# Altium schematic sheet Controller_Sheet.SchDoc
size 420 x 297 mm; SheetNumber: 4; SheetTotal: 4
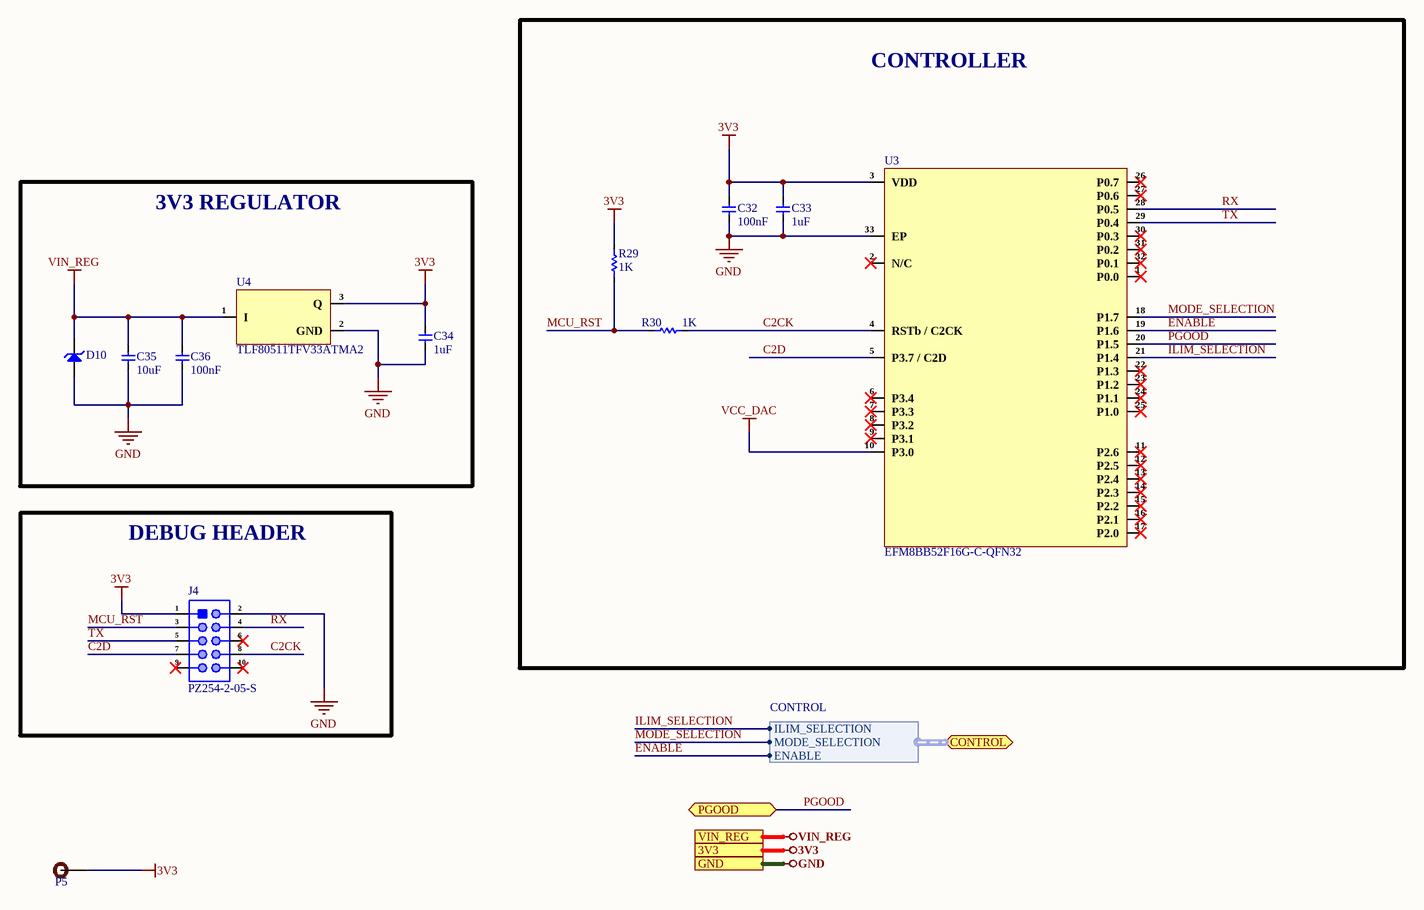
[diagram p0: Controller_Sheet.SchDoc]

## Parts
C32  100nF  [Cap-0603]
C33  1uF  [Cap-0603]
C34  1uF  [Cap-0603]
C35  10uF  [Cap-1206]
C36  100nF  [Cap-0603]
D10  1SMA5937BT3G  [SMA]  (value not drawn)
J4  PZ254-2-05-S  [PZ254-2-05-S]
P5  TEST POINT  [Test-point]  (value not drawn)  (no BOM)
R29  1K  [Res-0603]
R30  1K  [Res-0603]
U3  EFM8BB52F16G-C-QFN32  [32-QFN (5x5)]
U4  TLF80511TFV33ATMA2  [TO-252-2L]

## Blocks framed on the sheet
CONTROLLER: C32 C33 R29 R30 U3
3V3 REGULATOR: C34-C36 D10 U4
DEBUG HEADER: J4

## Ports
3V3, CONTROL (bidir, harness CONTROL), GND, PGOOD (bidir), VIN_REG

## Harnesses
CONTROL: ILIM_SELECTION, MODE_SELECTION, ENABLE

## Nets
3V3: C32.2 C33.2 C34.2 J4.1 P5.1 R29.2 U3.3(VDD) U4.3(Q) ; port 3V3
GND: C32.1 C33.1 C34.1 C35.1 C36.1 D10.2(A) J4.2 U3.33(EP) U4.2(GND) ; port GND
VCC_DAC: U3.10(P3.0)
VIN_REG: C35.2 C36.2 D10.1(K) U4.1(I) ; port VIN_REG
C2CK: J4.8 R30.2 U3.4(RSTb_/_C2CK)
C2D: J4.7 U3.5(P3.7_/_C2D)
ENABLE: U3.19(P1.6) ; port CONTROL.ENABLE
ILIM_SELECTION: U3.21(P1.4) ; port CONTROL.ILIM_SELECTION
MCU_RST: J4.3 R29.1 R30.1
MODE_SELECTION: U3.18(P1.7) ; port CONTROL.MODE_SELECTION
PGOOD: U3.20(P1.5) ; port PGOOD
RX: J4.4 U3.28(P0.5)
TX: J4.5 U3.29(P0.4)

Not connected (* = marked no-connect by the designer): J4 6* 9* 10*; U3 1(P0.0)* 2(N/C)* 6(P3.4)* 7(P3.3)* 8(P3.2)* 9(P3.1)* 11(P2.6)* 12(P2.5)* 13(P2.4)* 14(P2.3)* 15(P2.2)* 16(P2.1)* 17(P2.0)* 22(P1.3)* 23(P1.2)* 24(P1.1)* 25(P1.0)* 26(P0.7)* 27(P0.6)* 30(P0.3)* 31(P0.2)* 32(P0.1)*

## Notes on the sheet
- File:
- Title:
- Date:
- Page
- Num:
- Total:
- Drawn By: Huzaifa Ali

## Library data of the parts
C32 C36 = CC0603KRX5R9BB104: CAP CER 0.1UF 50V X5R 0603; Manufacturer: Yageo; Tolerance: 10%; Item Type: Capacitor; Supplier 1: Digi-Key; Manufacturer Part Number: CC0603KRX5R9BB104; RoHS: Yes; Category: Ceramic Capacitors; Stock 1: 152253; Pricing 1: 1=0.10000, 10=0.05200, 50=0.02820, 100=0.02310, 500=0.01648, 1000=0.01294 (USD); Mount: Surface Mount; Case/Package: 0603; Case Code (Imperial): 0603; Case Code (Metric): 1608; Weight: 7.1E-05oz; Min Operating Temperature: -55°C; Max Operating Temperature: 85°C; Capacitance: 100nF; Packaging: Tape and Reel; Voltage Rating: 50V; Dielectric: X5R; Termination: SMD/SMT; Voltage Rating (DC): 50V; Package Quantity: 4000; Length: 0.063inch; Width: 0.031inch; Thickness: 0.035inch; Lead Free: Lead Free; Halogen Free: Halogen Free; ComponentLink1URL: http://www.mouser.com/ds/2/447/Yageo_UPY-GP_NP0_16V-to-50V_9-358835.pdf?src-supplier=Mouser; ComponentLink1Description: http://www.mouser.com/ds/2/447/Yageo_UPY-GP_NP0_16V-to-50V_9-358835.pdf?src-supplier=Mouser; ComponentLink2URL: https://www.yageo.com/upload/media/product/productsearch/datasheet/mlcc/UPY-GPHC_X5R_4V-to-50V_26.pdf?src-supplier=Digi-Key; ComponentLink2Description: https://www.yageo.com/upload/media/product/productsearch/datasheet/mlcc/UPY-GPHC_X5R_4V-to-50V_26.pdf?src-supplier=Digi-Key; ComponentLink3URL: http://www.yageo.com/exep/pages/download/literatures/ProductSelectionGuide%202014_Final_2.pdf?src-supplier=Digi-Key; ComponentLink3Description: http://www.yageo.com/exep/pages/download/literatures/ProductSelectionGuide%202014_Final_2.pdf?src-supplier=Digi-Key; Supplier Part Number 1: 311-4046-1-ND; LCSC Part Number: C110022
C33 C34 = CC0603KRX5R8BB105: CAP CER 1UF 25V X5R 0603; Manufacturer: Yageo; Tolerance: 10%; Item Type: Capacitor; Supplier 1: Digi-Key; Manufacturer Part Number: CC0603KRX5R8BB105; RoHS: Yes; Category: Ceramic Capacitors; Stock 1: 919939; Pricing 1: 1=0.12000, 10=0.08400, 50=0.04760, 100=0.03940, 500=0.02764, 1000=0.02288 (USD); Mount: Surface Mount; Case/Package: 0603; Number of Pins: 2; Case Code (Metric): 1608; Case Code (Imperial): 0603; Min Operating Temperature: -55°C; Max Operating Temperature: 85°C; Capacitance: 1uF; Dielectric: X5R; Package Quantity: 1; Voltage Rating: 25V; Packaging: Tape and Reel; Termination: SMD/SMT; Voltage Rating (DC): 25V; Series: CC; Construction: Flat; Length: 1.6mm; Width: 0.031inch; Height: 0.8mm; Thickness: 0.035inch; Depth: 0.8mm; Radiation Hardening: No; REACH SVHC: No SVHC; Lead Free: Lead Free; Halogen Free: Halogen Free; RoHS Compliant: Yes; ComponentLink1URL: https://datasheet.ciiva.com/176/mlccorderingcode-176785.pdf?src-supplier=Digi-Key; ComponentLink1Description: https://datasheet.ciiva.com/176/mlccorderingcode-176785.pdf?src-supplier=Digi-Key; ComponentLink2URL: https://datasheet.ciiva.com/176/mlccorderingcode-176786.pdf?src-supplier=Digi-Key; ComponentLink2Description: https://datasheet.ciiva.com/176/mlccorderingcode-176786.pdf?src-supplier=Digi-Key; ComponentLink3URL: https://datasheet.ciiva.com/176/mlccorderingcode-176787.pdf?src-supplier=Digi-Key; ComponentLink3Description: https://datasheet.ciiva.com/176/mlccorderingcode-176787.pdf?src-supplier=Digi-Key; ComponentLink4URL: https://datasheet.ciiva.com/17436/upy-gphc-x5r-4v-to-50v-12-17436952.pdf?src-supplier=Avnet+Europe; ComponentLink4Description: https://datasheet.ciiva.com/17436/upy-gphc-x5r-4v-to-50v-12-17436952.pdf?src-supplier=Avnet+Europe; ComponentLink5URL: https://datasheet.ciiva.com/7978/1525783-7978171.pdf?src-supplier=Element14; ComponentLink5Description: https://datasheet.ciiva.com/7978/1525783-7978171.pdf?src-supplier=Element14; ComponentLink6URL: https://datasheet.ciiva.com/11586/upy-gphc-x5r-4v-to-50v-12-11586318.pdf?src-supplier=Avnet; ComponentLink6Description: https://datasheet.ciiva.com/11586/upy-gphc-x5r-4v-to-50v-12-11586318.pdf?src-supplier=Avnet; Supplier Part Number 1: 311-1445-1-ND; LCSC Part Number: C14664
C35 = CC1206KKX5R8BB106: CAP CER 10UF 25V X5R 1206; Manufacturer: Yageo; Tolerance: 10%; Supplier 1: Digi-Key; Manufacturer Part Number: CC1206KKX5R8BB106; RoHS: Yes; Category: Ceramic Capacitors; Stock 1: 206954; Pricing 1: 1=0.56000, 10=0.39800, 50=0.30080, 100=0.26190, 500=0.19402, 1000=0.16492 (USD); Mount: Surface Mount; Case/Package: 1206; Number of Pins: 2; Case Code (Imperial): 1206; Case Code (Metric): 3216; Min Operating Temperature: -55°C; Max Operating Temperature: 85°C; Capacitance: 10uF; Dielectric: X5R; Packaging: Tape and Reel; Voltage Rating: 25V; Package Quantity: 1; Termination: SMD/SMT; Voltage Rating (DC): 25V; Series: CC; Construction: Flat; Length: 3.2mm; Width: 0.063inch; Height: 1.6mm; Thickness: 0.071inch; Depth: 1.6mm; Radiation Hardening: No; Lead Free: Lead Free; Halogen Free: Halogen Free; RoHS Compliant: Yes; ComponentLink1URL: https://datasheet.ciiva.com/184/mlccorderingcode-184043.pdf?src-supplier=Digi-Key; ComponentLink1Description: https://datasheet.ciiva.com/184/mlccorderingcode-184043.pdf?src-supplier=Digi-Key; ComponentLink2URL: https://datasheet.ciiva.com/184/mlccorderingcode-184042.pdf?src-supplier=Digi-Key; ComponentLink2Description: https://datasheet.ciiva.com/184/mlccorderingcode-184042.pdf?src-supplier=Digi-Key; ComponentLink3URL: https://datasheet.ciiva.com/184/mlccorderingcode-184044.pdf?src-supplier=Digi-Key; ComponentLink3Description: https://datasheet.ciiva.com/184/mlccorderingcode-184044.pdf?src-supplier=Digi-Key; ComponentLink4URL: https://datasheet.ciiva.com/11466/upy-gphc-x5r-4v-to-50v-12-11466558.pdf?src-supplier=Avnet; ComponentLink4Description: https://datasheet.ciiva.com/11466/upy-gphc-x5r-4v-to-50v-12-11466558.pdf?src-supplier=Avnet; ComponentLink5URL: https://datasheet.ciiva.com/15189/getdatasheetpartid-344055-15189254.pdf?src-supplier=Verical; ComponentLink5Description: https://datasheet.ciiva.com/15189/getdatasheetpartid-344055-15189254.pdf?src-supplier=Verical; Supplier Part Number 1: 311-1466-1-ND
D10 = 1SMA5937BT3G: DIODE ZENER 33V 1.5W SMA; Manufacturer: ON Semiconductor; Supplier: Rs; Supplier Part Number: 7925363; Manufacturer Part Number: 1SMA5937BT3G; RoHS: Yes; Category: Zener Diodes; Stock: 3380; Pricing: 20=0.231, 100=0.164, 200=0.159, 400=0.154, 800=0.152 (GBP); ComponentLink1URL: https://datasheet.ciiva.com/30478/0900766b8127698c-30478606.pdf?src-supplier=Rs; ComponentLink1Description: https://datasheet.ciiva.com/30478/0900766b8127698c-30478606.pdf?src-supplier=Rs; ComponentLink2URL: https://datasheet.ciiva.com/1182/1sma5913bt3-d-1182598.pdf?src-supplier=Element14; ComponentLink2Description: https://datasheet.ciiva.com/1182/1sma5913bt3-d-1182598.pdf?src-supplier=Element14; ComponentLink3URL: https://datasheet.ciiva.com/1182/1sma5913bt3-d-1182599.pdf?src-supplier=Element14; ComponentLink3Description: https://datasheet.ciiva.com/1182/1sma5913bt3-d-1182599.pdf?src-supplier=Element14; Item Type: Diode
J4 = PZ254-2-05-S: 250V 3A Brick nogging Square Pins 2.5mm 260℃@5S 6mm 10P -40℃~+105℃ 2.54mm 双排 Black 2.54mm 2x5P SMD,P=2.54mm Pin Headers ROHS; Manufacturer: HCTL; Item Type: Male Header; Manufacturer Part Number: PZ254-2-05-S; LCSC Part Number: C3294463
P5 = TEST POINT: Test Point ON; Item Type: TEST POINT
R29 R30 = RT0603BRD071KL: RES SMD 1K OHM 0.1% 1/10W 0603; Manufacturer: Yageo; Resistance: 1kR; Power Rating: 100mW; Voltage Rating: 75V; Temperature Coefficient: 25ppm/°C; Voltage Rating (DC): 50V; Item Type: Resistor; Supplier 1: Arrow Electronics; Manufacturer Part Number: RT0603BRD071KL; RoHS: Yes; Category: Chip SMD Resistors; Stock 1: 130000; Pricing 1: 5000=0.03900, 10000=0.03450, 25000=0.03070, 50000=0.02040 (USD); Mount: Surface Mount; Case/Package: 0603; Case Code (Metric): 1608; Case Code (Imperial): 0603; Contact Plating: Tin,Lead; Size Code: 0603; Min Operating Temperature: -55°C; Max Operating Temperature: 125°C; Package Quantity: 5000; Packaging: Tape and Reel; Resistor Type: Thin Film; Number of Terminations: 2; Termination: SMD/SMT; Max Power Dissipation: 100mW; Features: Moisture Resistant; Series: RT; Technology: THIN FILM; Construction: Rectangular; Length: 1.6mm; Width: 0.031inch; Height: 0.022inch; Depth: 0.8mm; Military Standard: Not; Lead Free: Lead Free; RoHS Compliant: Yes; ComponentLink1URL: https://datasheet.ciiva.com/11819/0900766b8079c86e-11819652.pdf?src-supplier=RSComponents; ComponentLink1Description: https://datasheet.ciiva.com/11819/0900766b8079c86e-11819652.pdf?src-supplier=RSComponents; ComponentLink2URL: https://datasheet.ciiva.com/5624/pyu-rt-1-to-0-05-rohs-l-4-5624759.pdf?src-supplier=Mouser; ComponentLink2Description: https://datasheet.ciiva.com/5624/pyu-rt-1-to-0-05-rohs-l-4-5624759.pdf?src-supplier=Mouser; ComponentLink3URL: https://datasheet.ciiva.com/29718/pyu-rt-1-to-0-05-rohs-l-4-29718010.pdf?src-supplier=Digi-Key; ComponentLink3Description: https://datasheet.ciiva.com/29718/pyu-rt-1-to-0-05-rohs-l-4-29718010.pdf?src-supplier=Digi-Key; ComponentLink4URL: https://datasheet.ciiva.com/29718/pyu-rt-1-to-0-05-rohs-l-4-29718011.pdf?src-supplier=Digi-Key; ComponentLink4Description: https://datasheet.ciiva.com/29718/pyu-rt-1-to-0-05-rohs-l-4-29718011.pdf?src-supplier=Digi-Key; Supplier Part Number 1: RT0603BRD071KL; LCSC Part Number: C110776
U3 = EFM8BB52F16G-C-QFN32: IC MCU 8BIT 16KB FLASH 32QFN; Manufacturer: Silicon Labs; Supplier: Arrow Electronics; Supplier Part Number: EFM8BB52F16G-C-QFN32; Manufacturer Part Number: EFM8BB52F16G-C-QFN32; RoHS: No; Category: Uncategorized; Stock: 540; Pricing: 1=0.5847, 10=0.5643, 100=0.5088, 600=0.5037, 1000=0.48 (USD); Item Type: IC
U4 = TLF80511TFV33ATMA2: IC REG LIN 3.3V 400MA TO252-3-11; Manufacturer: Infineon; Supplier: Future Electronics; Supplier Part Number: 6060699; Manufacturer Part Number: TLF80511TFV33ATMA2; RoHS: Yes; Pricing: 2500=0.745 (USD); RoHS Compliant: Yes; Item Type: IC